# Altium schematic sheet Controller-Sheet.SchDoc
size A4; SheetNumber: 3; SheetTotal: 5
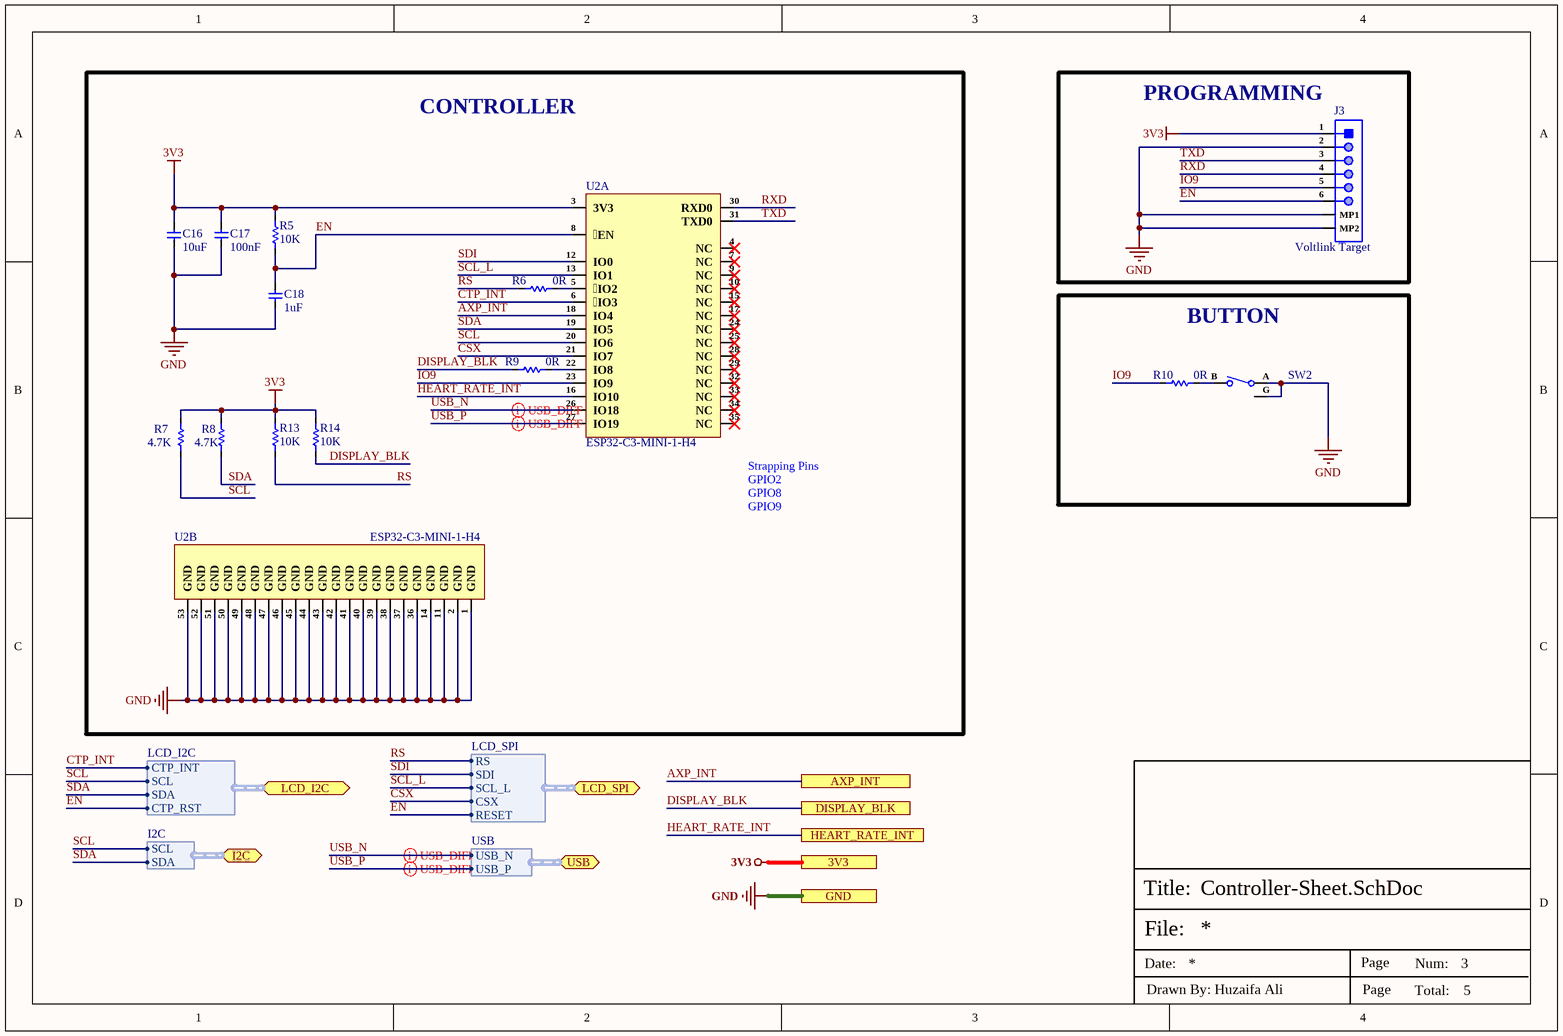
[diagram p0: Controller-Sheet.SchDoc]

## Parts
C16  10uF  [Cap-0402]
C17  100nF  [CAP-0201]
C18  1uF  [CAP-0201]
J3  Voltlink Target  [Voltlink Target]
R5  10K  [Res-0201]
R6  0R  [Res-0201]
R7  4.7K  [Res-0201]
R8  4.7K  [Res-0201]
R9  0R  [Res-0201]
R10  0R  [Res-0201]
R13  10K  [Res-0201]
R14  10K  [Res-0201]
SW2  R-667799  [R-667799]  (value not drawn)
U2  ESP32-C3-MINI-1-H4  [ESP32-C3-MINI-1-H4]  (parts A,B of 2)

## Blocks framed on the sheet
CONTROLLER: C16-C18 R5-R9 R13 R14 U2
PROGRAMMING: J3
BUTTON: R10 SW2

## Ports
3V3 (see Top-Sheet[2B], Display-Sheet[3D], Power-Sheet[2D], Sensor-Sheet[3C]), AXP_INT (see Top-Sheet[2B], Power-Sheet[2D]), DISPLAY_BLK (see Top-Sheet[2B], Display-Sheet[2D]), GND (see Top-Sheet[2B], Display-Sheet[3D], Power-Sheet[2D], Sensor-Sheet[3C]), HEART_RATE_INT (see Top-Sheet[2B], Sensor-Sheet[3C]), I2C (bidir, harness I2C, see Top-Sheet[2B], Power-Sheet[1D], Sensor-Sheet[3C]), LCD_I2C (bidir, harness LCD_I2C, see Top-Sheet[2B], Display-Sheet[2D]), LCD_SPI (bidir, harness LCD_SPI, see Top-Sheet[2B], Display-Sheet[2D]), USB (bidir, harness USB, see Top-Sheet[2B], Power-Sheet[1C])

## Harnesses
LCD_I2C: CTP_INT, SCL, SDA, CTP_RST
USB: USB_N, USB_P
LCD_SPI: RS, SDI, SCL_L, CSX, RESET
I2C: SCL, SDA

## Nets
3V3: C16.2 C17.2 J3.1 R5.2 R7.2 R8.2 R13.2 R14.2 U2.3(3V3) ; port 3V3
GND: C16.1 C17.1 C18.1 J3.2 J3.MP1 J3.MP2 SW2.A SW2.G U2.1(GND) U2.2(GND) U2.11(GND) U2.14(GND) U2.36(GND) U2.37(GND) U2.38(GND) U2.39(GND) U2.40(GND) U2.41(GND) U2.42(GND) U2.43(GND) U2.44(GND) U2.45(GND) U2.46(GND) U2.47(GND) U2.48(GND) U2.49(GND) U2.50(GND) U2.51(GND) U2.52(GND) U2.53(GND) ; port GND
AXP_INT: U2.18(IO4) ; port AXP_INT
CSX: U2.21(IO7) ; port LCD_SPI.CSX
CTP_INT: U2.6(IO3) ; port LCD_I2C.CTP_INT
DISPLAY_BLK: R9.1 R14.1 ; port DISPLAY_BLK
EN: C18.2 J3.6 R5.1 U2.8(EN) ; port LCD_I2C.CTP_RST, port LCD_SPI.RESET
HEART_RATE_INT: U2.16(IO10) ; port HEART_RATE_INT
IO9: J3.5 R10.1 U2.23(IO9)
RS: R6.1 R13.1 ; port LCD_SPI.RS
RXD: J3.4 U2.30(RXD0)
SCL: R7.1 U2.20(IO6) ; port LCD_I2C.SCL, port I2C.SCL
SCL_L: U2.13(IO1) ; port LCD_SPI.SCL_L
SDA: R8.1 U2.19(IO5) ; port LCD_I2C.SDA, port I2C.SDA
SDI: U2.12(IO0) ; port LCD_SPI.SDI
TXD: J3.3 U2.31(TXD0)
USB_N: U2.26(IO18) ; port USB.USB_N
USB_P: U2.27(IO19) ; port USB.USB_P
NetR6_2: R6.2 U2.5(IO2)
NetR9_2: R9.2 U2.22(IO8)
NetR10_2: R10.2 SW2.B

Not connected (* = marked no-connect by the designer): U2 4(NC)* 7(NC)* 9(NC)* 10(NC)* 15(NC)* 17(NC)* 24(NC)* 25(NC)* 28(NC)* 29(NC)* 32(NC)* 33(NC)* 34(NC)* 35(NC)*

## Layout directives
differential pair; net class USB_DIFF; differential pair class USB_DIFF_Lines; rule Matched Net Lengths [Tolerance = 20mil]; rule Impedance Constraint [Min = 85.00    Max = 95.00    ]: USB_N, USB_P

## Notes on the sheet
- (near U2) Strapping Pins
  GPIO2
  GPIO8
  GPIO9
- File:
- Title:
- Date:
- Page
- Num:
- Total:
- Drawn By: Huzaifa Ali

## Library data of the parts
C16 = CC0402MRX5R6BB106: CAP CER 10UF 10V X5R 0402; Manufacturer: Yageo; Tolerance: 20%; Item Type: Capacitor; Supplier 1: Future Electronics; Manufacturer Part Number: CC0402MRX5R6BB106; RoHS: Yes; Category: Ceramic Capacitors; Stock 1: 80000; Pricing 1: 10000=0.02650, 20000=0.02590, 30000=0.02550, 40000=0.02530, 50000=0.02450 (USD); Mount: Surface Mount; Case/Package: 0402; Case Code (Imperial): 0402; Case Code (Metric): 1005; Min Operating Temperature: -55°C; Max Operating Temperature: 85°C; Packaging: Tape and Reel; Capacitance: 10uF; Voltage Rating: 10V; RoHS Compliant: Yes; ComponentLink1URL: http://www.yageo.com/documents/recent/UPY-GPHC_X5R_4V-to-50V_25.pdf?src-supplier=Digi-Key; ComponentLink1Description: http://www.yageo.com/documents/recent/UPY-GPHC_X5R_4V-to-50V_25.pdf?src-supplier=Digi-Key; Supplier Part Number 1: 6097631; LCSC Part Number: C962143
C17 = CC0201KRX5R6BB104: CAP CER 0.1UF 10V X5R 0201; Manufacturer: Yageo; Tolerance: 10%; Supplier 1: Mouser; Manufacturer Part Number: CC0201KRX5R6BB104; RoHS: Yes; Category: Ceramic Capacitors; Stock 1: 824403; Pricing 1: 1=0.10000, 10=0.02400, 50=0.02400, 100=0.01900, 1000=0.01100, 10000=0.00900 (USD); Mount: Surface Mount; Case/Package: 0201; Case Code (Imperial): 0201; Case Code (Metric): 0603; Weight: 6E-06oz; Min Operating Temperature: -55°C; Max Operating Temperature: 85°C; Capacitance: 100nF; Dielectric: X5R; Voltage Rating (DC): 10V; Packaging: Tape and Reel; Termination: SMD/SMT; Resistor Type: Ceramic; Voltage Rating: 10V; Series: CC; Construction: Flat; Length: 0.6mm; Width: 0.012inch; Height: 0.3mm; Thickness: 0.013inch; Depth: 0.3mm; Radiation Hardening: No; Lead Free: Lead Free; Halogen Free: Halogen Free; RoHS Compliant: Yes; ComponentLink1URL: https://datasheet.ciiva.com/11587/upy-gphc-x5r-4v-to-50v-12-11587190.pdf?src-supplier=Avnet; ComponentLink1Description: https://datasheet.ciiva.com/11587/upy-gphc-x5r-4v-to-50v-12-11587190.pdf?src-supplier=Avnet; Supplier Part Number 1: 603-CC201KRX5R6BB104; LCSC Part Number: C190183
C18 = CC0201MRX5R7BB105: CAP CER 1UF 16V X5R 0201; Manufacturer: Yageo; Item Type: Capacitor; Supplier: Digi-Key; Supplier Part Number: 13-CC0201MRX5R7BB105TR-ND; Manufacturer Part Number: CC0201MRX5R7BB105; RoHS: Yes; Category: Ceramic Capacitors; LCSC Part Number: C5182464
J3 = C145963: 1x6P SH 1 1mm 6 SMD,P=1mm Wire To Board / Wire To Wire Connector ROHS; Manufacturer: BOOMELE; Manufacturer Part Number: C145963; Package: SMD,P=1mm; LCSC Part Number: C145963; Item Type: Connector; ComponentLink1Description: LCSC; ComponentLink1URL: https://www.lcsc.com/product-detail/Wire-To-Board-Wire-To-Wire-Connector_BOOMELE-Boom-Precision-Elec-C145963_C145963.html
R5 R13 R14 = RC0201FR-0710KL: RES SMD 10K OHM 1% 1/20W 0201; Manufacturer: Yageo; Item Type: Resistor; Manufacturer Part Number: RC0201FR-0710KL; Package: 0201; ComponentLink7Description: LCSC; ComponentLink7URL: https://www.lcsc.com/product-detail/Chip-Resistor-Surface-Mount_YAGEO-RC0201FR-0710KL_C106225.html; LCSC Part Number: C106225
R6 R9 R10 = RC0201JR-070RL: RES SMD 0 OHM JUMPER 1/20W 0201; Manufacturer: Yageo; Power Rating: 50mW; Tolerance: 5%; Voltage Rating: 25V; Supplier 1: Digi-Key; Manufacturer Part Number: RC0201JR-070RL; RoHS: Yes; Category: Chip SMD Resistors; Stock 1: 11079; Pricing 1: 1=0.10000, 10=0.03600, 25=0.02640, 50=0.02000, 100=0.01480, 250=0.01128, 500=0.00904, 1000=0.00665, 5000=0.00477 (USD); Case/Package: 0201; Contact Plating: Tin,Matte; Case Code (Metric): 0603; Case Code (Imperial): 0201; Weight: 6E-06oz; Size Code: 0201; Min Operating Temperature: -55°C; Max Operating Temperature: 125°C; Resistor Type: Thick Film; Resistance: 0R; Packaging: Tape and Reel; Package Quantity: 10000; Number of Terminations: 2; Termination: SMD/SMT; Max Power Dissipation: 50mW; Voltage Rating (DC): 25V; Features: Moisture Resistant; Series: RC; Construction: Rectangular; Resistance Tolerance: 5%; Length: 0.6mm; Width: 0.012inch; Height: 0.01inch; Depth: 0.3mm; Radiation Hardening: No; RoHS Compliant: Yes; REACH SVHC: Unknown; Military Standard: Not; Lead Free: Lead Free; ComponentLink1URL: https://datasheet.ciiva.com/7672/1563626-7672247.pdf?src-supplier=Element14; ComponentLink1Description: https://datasheet.ciiva.com/7672/1563626-7672247.pdf?src-supplier=Element14; ComponentLink2URL: https://datasheet.ciiva.com/7660/1421516-7660808.pdf?src-supplier=Element14; ComponentLink2Description: https://datasheet.ciiva.com/7660/1421516-7660808.pdf?src-supplier=Element14; ComponentLink3URL: https://datasheet.ciiva.com/7672/1563626-7672248.pdf?src-supplier=Element14; ComponentLink3Description: https://datasheet.ciiva.com/7672/1563626-7672248.pdf?src-supplier=Element14; ComponentLink4URL: https://datasheet.ciiva.com/16855/pyu-rc0201-51-rohs-l-8-16855994.pdf?src-supplier=Avnet+Europe; ComponentLink4Description: https://datasheet.ciiva.com/16855/pyu-rc0201-51-rohs-l-8-16855994.pdf?src-supplier=Avnet+Europe; ComponentLink5URL: https://datasheet.ciiva.com/28419/pyu-rc0201-51-rohs-l-8-28419660.pdf?src-supplier=Avnet+Europe; ComponentLink5Description: https://datasheet.ciiva.com/28419/pyu-rc0201-51-rohs-l-8-28419660.pdf?src-supplier=Avnet+Europe; ComponentLink6URL: https://datasheet.ciiva.com/46391/1421516-46391340.pdf?src-supplier=Element14; ComponentLink6Description: https://datasheet.ciiva.com/46391/1421516-46391340.pdf?src-supplier=Element14; ComponentLink7URL: https://datasheet.ciiva.com/8896/pyu-rc0201-51-rohs-l-8-8896143.pdf?src-supplier=Avnet; ComponentLink7Description: https://datasheet.ciiva.com/8896/pyu-rc0201-51-rohs-l-8-8896143.pdf?src-supplier=Avnet; Supplier Part Number 1: 311-0.0NCT-ND; LCSC Part Number: C106228
R7 R8 = RC0201FR-074K7L: RES 4.7K OHM 1% 1/20W 0201; Manufacturer: Yageo; Item Type: Resistor; Supplier: Future Electronics; Supplier Part Number: 7537285; Manufacturer Part Number: RC0201FR-074K7L; RoHS: Yes; Category: Chip SMD Resistors; Stock: 1610000; Pricing: 10000=0.0014, 50000=0.0013, 250000=0.0013, 750000=0.0012, 2000000=0.0011 (USD); ComponentLink1URL: https://datasheet.ciiva.com/2493/pyu-r-int-thick-7-2493811.pdf?src-supplier=Digi-Key; ComponentLink1Description: https://datasheet.ciiva.com/2493/pyu-r-int-thick-7-2493811.pdf?src-supplier=Digi-Key; ComponentLink2URL: https://datasheet.ciiva.com/2493/pyu-r-int-thick-7-2493812.pdf?src-supplier=Digi-Key; ComponentLink2Description: https://datasheet.ciiva.com/2493/pyu-r-int-thick-7-2493812.pdf?src-supplier=Digi-Key; ComponentLink3URL: https://datasheet.ciiva.com/2493/pyu-r-int-thick-7-2493813.pdf?src-supplier=Digi-Key; ComponentLink3Description: https://datasheet.ciiva.com/2493/pyu-r-int-thick-7-2493813.pdf?src-supplier=Digi-Key; ComponentLink4URL: https://datasheet.ciiva.com/8892/pyu-rc0201-51-rohs-l-8-8892942.pdf?src-supplier=Avnet; ComponentLink4Description: https://datasheet.ciiva.com/8892/pyu-rc0201-51-rohs-l-8-8892942.pdf?src-supplier=Avnet; ComponentLink5URL: https://datasheet.ciiva.com/7672/1563626-7672233.pdf?src-supplier=Element14; ComponentLink5Description: https://datasheet.ciiva.com/7672/1563626-7672233.pdf?src-supplier=Element14; LCSC Part Number: C138135
SW2 = R-667799: SWITCH TACTILE, SPST-NO, 0.05A 1; Manufacturer: Mitsumi; Item Type: Tactile Switch; Supplier: Digi-Key; Supplier Part Number: 2508-R-667799CT-ND; Manufacturer Part Number: R-667799; RoHS: No; Category: Tactile Switches; Stock: 11526; Pricing: 1=0.32, 10=0.31, 25=0.2944, 100=0.2666, 250=0.24304, 500=0.2259, 1000=0.19271, 2500=0.18736 (USD)
U2 = ESP32-C3-MINI-1-H4: RF TXRX MODULE BT PCB TRACE SMD; Manufacturer: Espressif Systems; Manufacturer Part Number: ESP32-C3-MINI-1-H4; Package: SMD,13.2x16.6mm; LCSC Part Number: C2934569; Item Type: Module; ComponentLink1Description: LCSC; ComponentLink1URL: https://www.lcsc.com/product-detail/WiFi-Modules_Espressif-Systems-ESP32-C3-MINI-1-H4_C2934569.html; Supplier: Digi-Key; Supplier Part Number: 1965-ESP32-C3-MINI-1-H4CT-ND; RoHS: No; Category: Uncategorized; Stock: 35793; Pricing: 1=1.9 (USD)